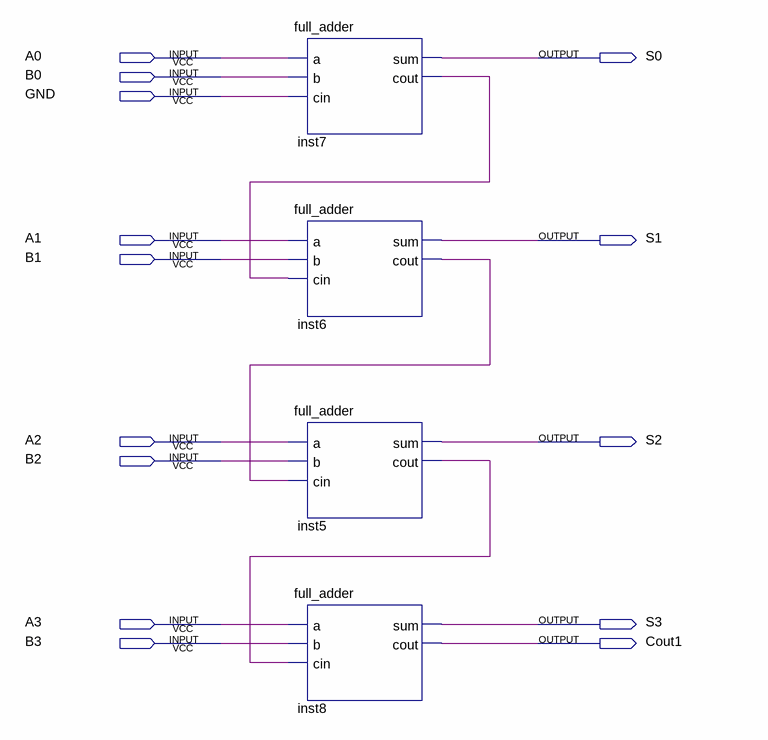
[diagram p0: schematic sheet]
// Quartus schematic 4-bit_adder.bdf as structural Verilog: 4 symbols, 14 pins
module \4-bit_adder  (
  input  A0,
  input  B0,
  input  GND,
  input  A1,
  input  B1,
  input  A2,
  input  B2,
  input  A3,
  input  B3,
  output S0,
  output S1,
  output S2,
  output S3,
  output Cout1
);

  wire inst5_cout, inst6_cout, inst7_cout;

  full_adder inst7 (.a(A0), .b(B0), .cin(GND), .sum(S0), .cout(inst7_cout));
  full_adder inst6 (.a(A1), .b(B1), .cin(inst7_cout), .sum(S1), .cout(inst6_cout));
  full_adder inst5 (.a(A2), .b(B2), .cin(inst6_cout), .sum(S2), .cout(inst5_cout));
  full_adder inst8 (.a(A3), .b(B3), .cin(inst5_cout), .sum(S3), .cout(Cout1));
endmodule
